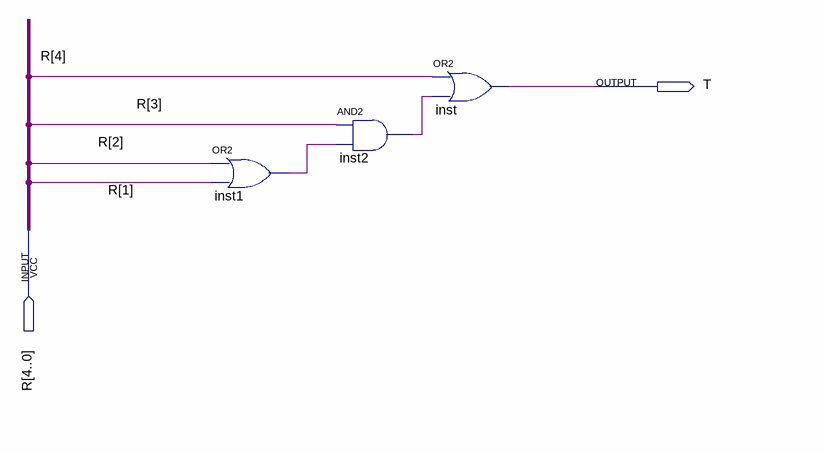
[diagram p0: schematic sheet]
// Quartus schematic DEZENA_T.bdf as structural Verilog: 3 symbols, 2 pins
module DEZENA_T (
  input  [4:0] R,
  output T
);

  wire inst1_out, inst2_out;

  or inst1 (inst1_out, R[2], R[1]);
  and inst2 (inst2_out, R[3], inst1_out);
  or inst (T, R[4], inst2_out);
endmodule
